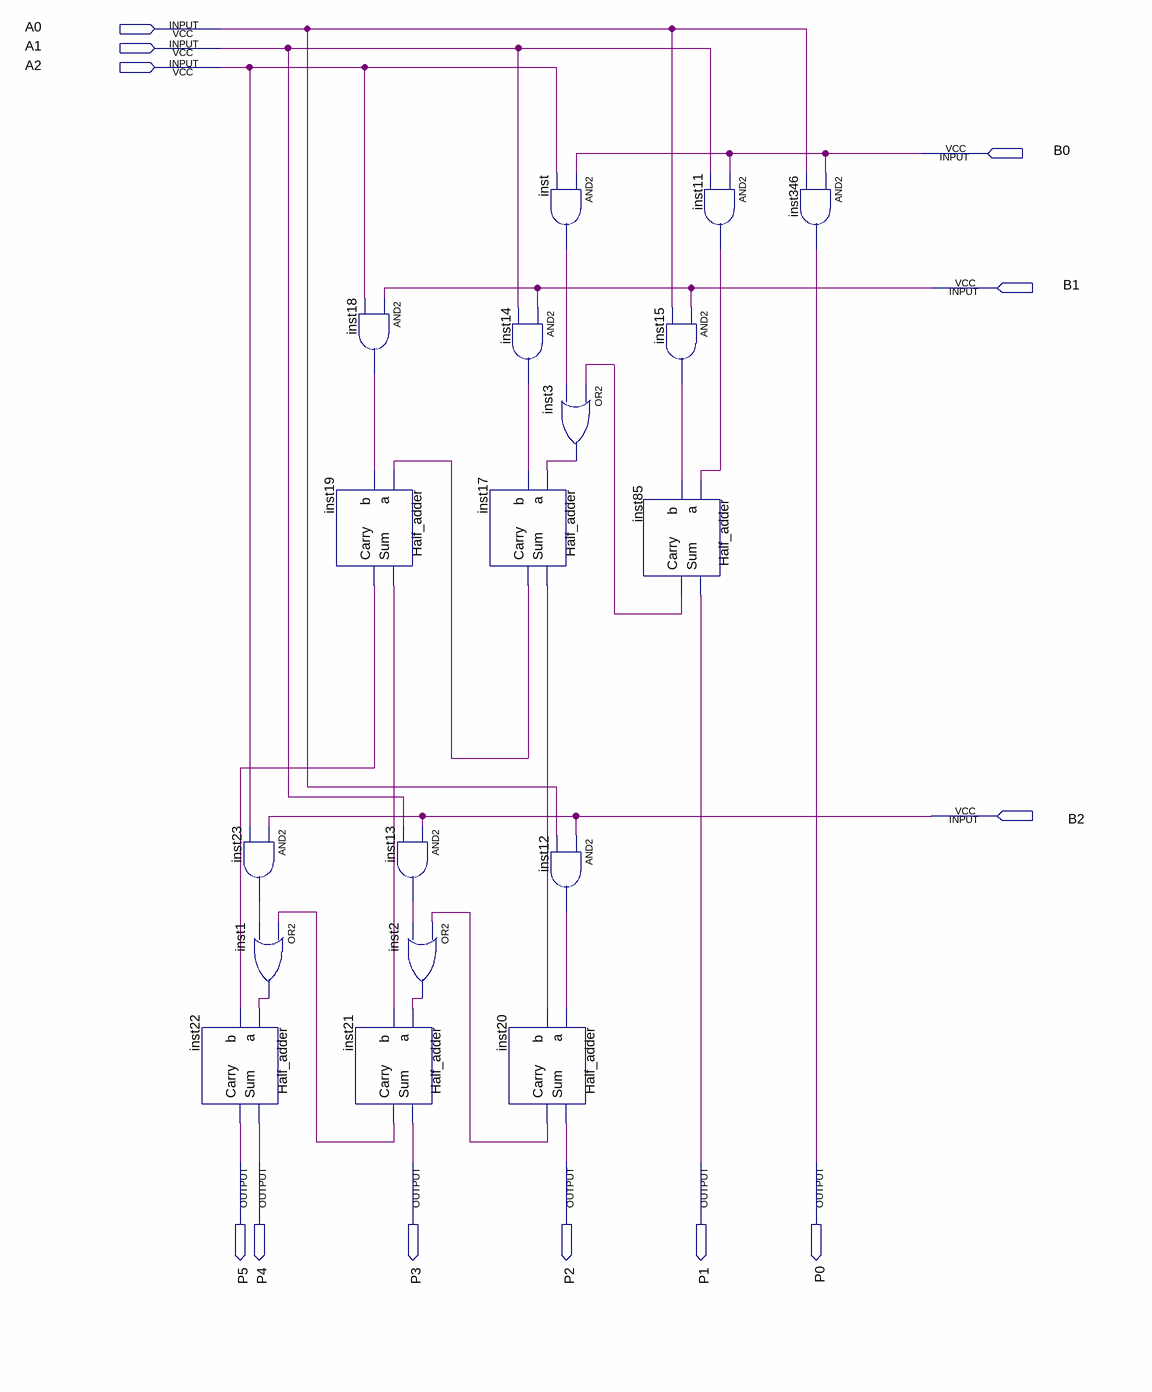
[diagram p0: schematic sheet]
// Quartus schematic multiplication.bdf as structural Verilog: 18 symbols, 12 pins
module multiplication (
  input  A0,
  input  A1,
  input  A2,
  input  B0,
  input  B1,
  input  B2,
  output P5,
  output P4,
  output P3,
  output P2,
  output P1,
  output P0
);

  wire inst1_out, inst2_out, inst3_out, inst11_out, inst12_out, inst13_out, inst14_out, inst15_out,
       inst17_carry, inst17_sum, inst18_out, inst19_carry, inst19_sum, inst20_carry, inst21_carry,
       inst23_out, inst85_carry, inst_out;

  Half_adder inst22 (.a(inst1_out), .b(inst19_carry), .Sum(P4), .Carry(P5));
  and inst23 (inst23_out, B2, A2);
  or inst1 (inst1_out, inst21_carry, inst23_out);
  and inst18 (inst18_out, B1, A2);
  Half_adder inst19 (.a(inst17_carry), .b(inst18_out), .Sum(inst19_sum), .Carry(inst19_carry));
  Half_adder inst21 (.a(inst2_out), .b(inst19_sum), .Sum(P3), .Carry(inst21_carry));
  and inst13 (inst13_out, B2, A1);
  or inst2 (inst2_out, inst20_carry, inst13_out);
  and inst14 (inst14_out, B1, A1);
  Half_adder inst17 (.a(inst3_out), .b(inst14_out), .Sum(inst17_sum), .Carry(inst17_carry));
  Half_adder inst20 (.a(inst12_out), .b(inst17_sum), .Sum(P2), .Carry(inst20_carry));
  and inst (inst_out, B0, A2);
  or inst3 (inst3_out, inst85_carry, inst_out);
  and inst12 (inst12_out, B2, A0);
  and inst15 (inst15_out, B1, A0);
  Half_adder inst85 (.a(inst11_out), .b(inst15_out), .Sum(P1), .Carry(inst85_carry));
  and inst11 (inst11_out, B0, A1);
  and inst346 (P0, B0, A0);
endmodule
